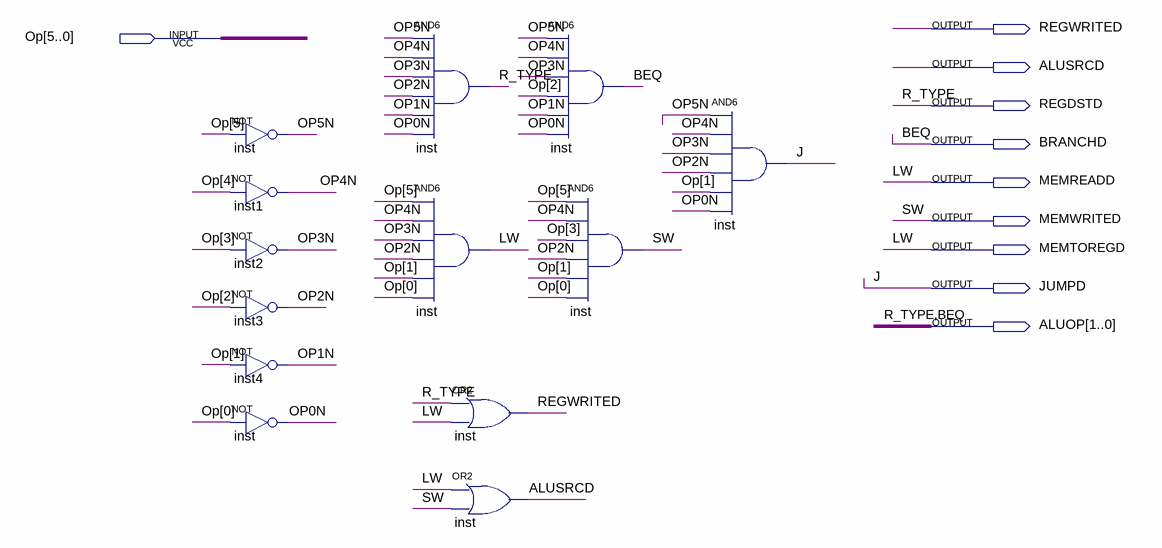
[diagram p0: schematic sheet]
// Quartus schematic ALU_MAIN.bdf as structural Verilog: 13 symbols, 10 pins
module ALU_MAIN (
  input  [5:0] Op,
  output REGWRITED,
  output ALUSRCD,
  output REGDSTD,
  output BRANCHD,
  output MEMREADD,
  output MEMWRITED,
  output MEMTOREGD,
  output JUMPD,
  output [1:0] ALUOP
);

  wire OP0N, OP1N, OP2N, OP3N, OP4N, OP5N;

  not inst (OP5N, Op[5]);
  not inst1 (OP4N, Op[4]);
  not inst2 (OP3N, Op[3]);
  not inst3 (OP2N, Op[2]);
  not inst4 (OP1N, Op[1]);
  not inst_dup2 (OP0N, Op[0]);
  and inst_dup3 (ALUOP[1], OP5N, OP4N, OP3N, OP2N, OP1N, OP0N);
  and inst_dup4 (MEMREADD, Op[5], OP4N, OP3N, OP2N, Op[1], Op[0]);
  or inst_dup5 (REGWRITED, ALUOP[1], MEMREADD);
  or inst_dup6 (ALUSRCD, MEMREADD, MEMWRITED);
  and inst_dup7 (ALUOP[0], OP5N, OP4N, OP3N, Op[2], OP1N, OP0N);
  and inst_dup8 (MEMWRITED, Op[5], OP4N, Op[3], OP2N, Op[1], Op[0]);
  and inst_dup9 (JUMPD, OP5N, OP4N, OP3N, OP2N, Op[1], OP0N);

  assign BRANCHD = ALUOP[0];
  assign MEMTOREGD = MEMREADD;
  assign REGDSTD = ALUOP[1];

  // Other names for the same wires on the sheet: BEQ = ALUOP[0]; J = JUMPD; LW = MEMREADD; R_TYPE = ALUOP[1];
  //   SW = MEMWRITED
endmodule
